# Altium schematic sheet USB接口 PHY_IO.schdoc
size 420 x 297 mm; Symbol: Drawing-Symbol_A4; Company: 嘉立创EDA; Version: V1.0; Page Size: A4; @Project Name: RK3566; @Update Date: 2026-10-05; @Create Date: 2026-05-22; Device: Drawing-Symbol_A4; @Board Name: Board1; @Page Name: P2; @Create Time: 17:31:19; @Page Count: 9; @Page No: 9; @Schematic Name: Schematic1; @Update Time: 17:31:19; @Assembly Variant: Basic; Border: 1; Title Block Position: 3; Size: A4; Width: 1655; Height: 1170; Region Start: 1; X Region Count: 6; Y Region Count: 4; Blade Width: 10; SheetNumber: 5; SheetTotal: 11
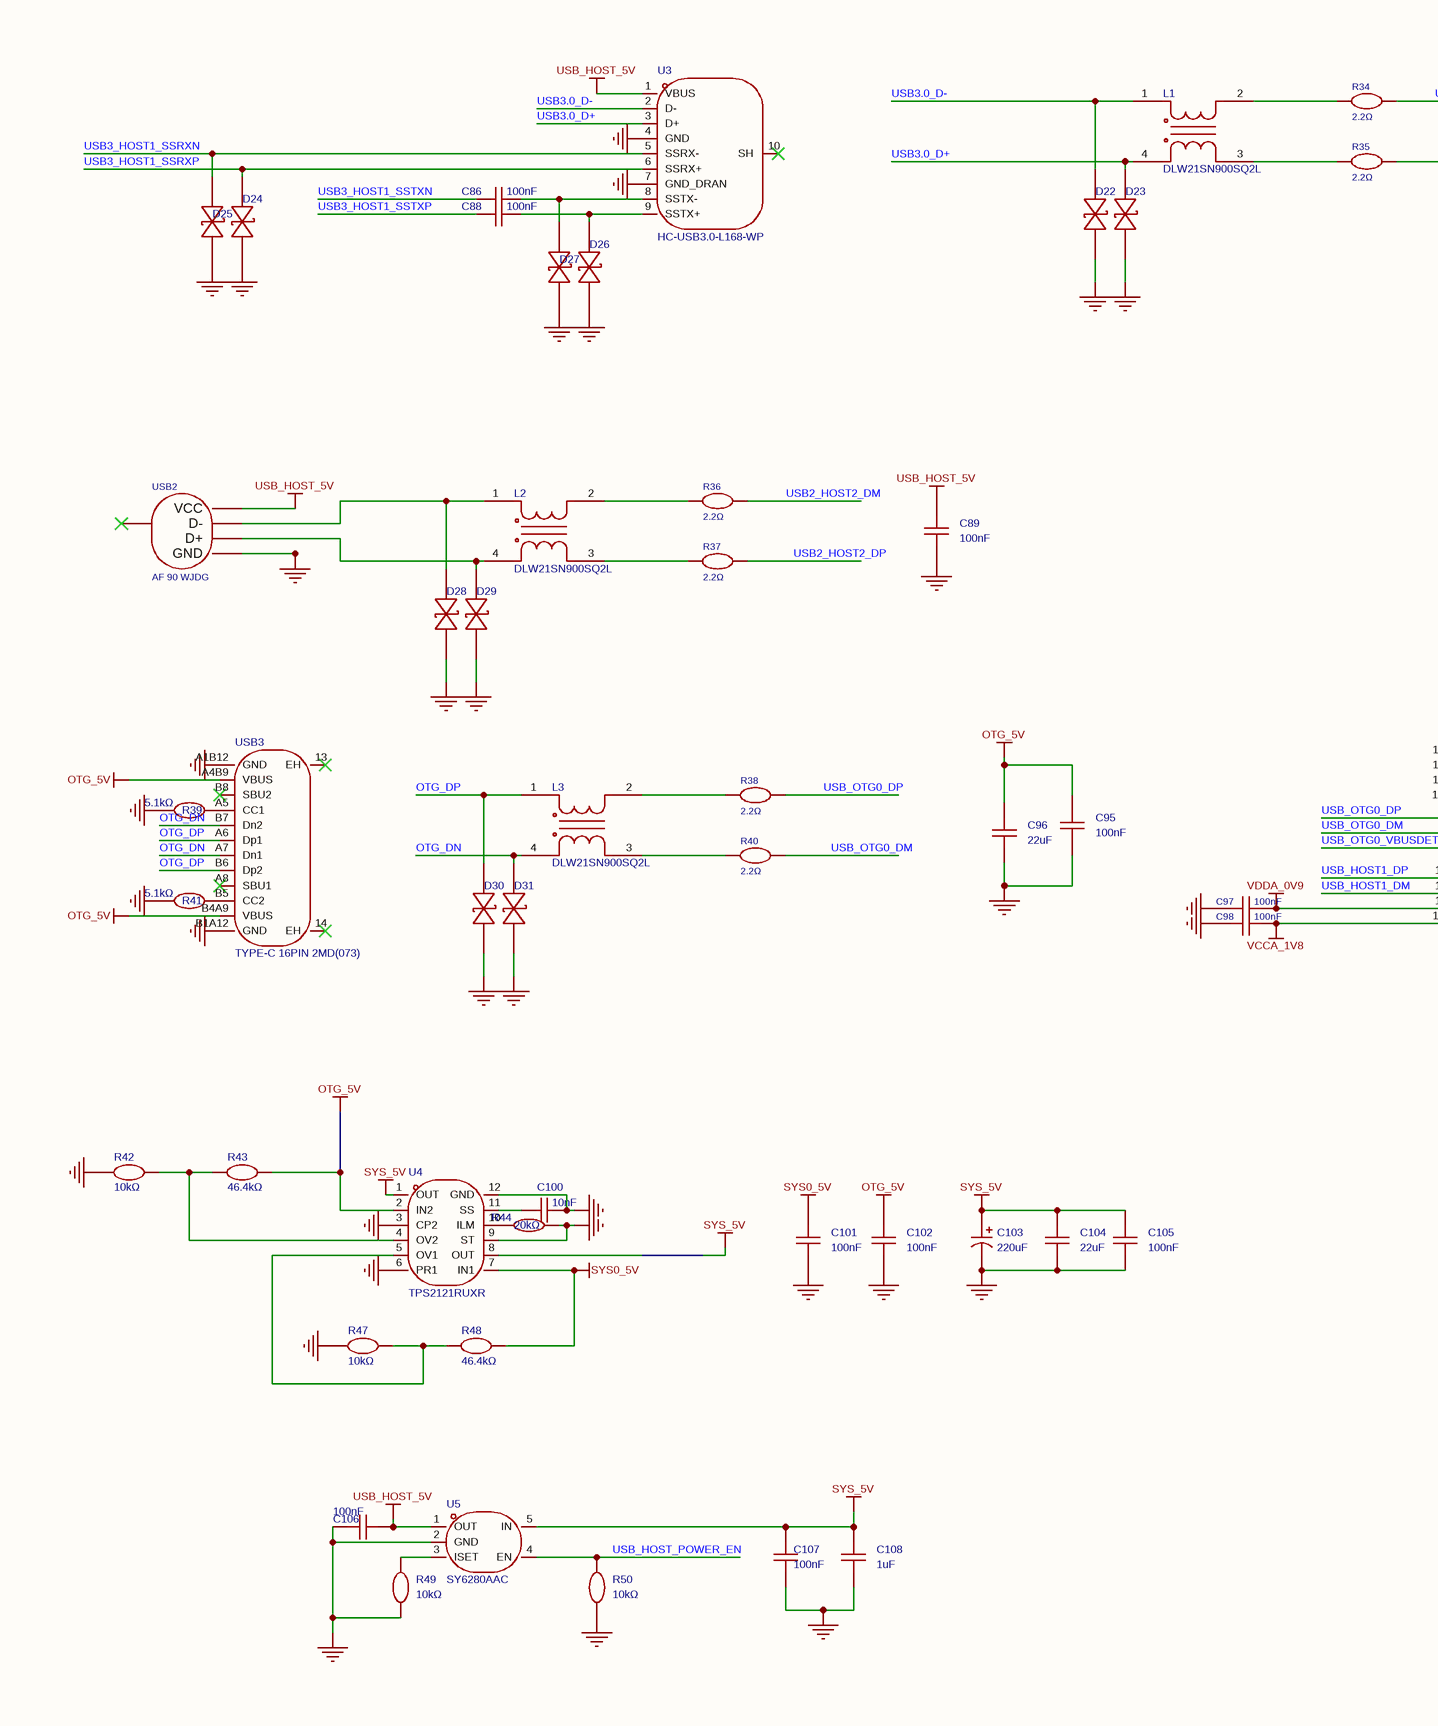
[diagram p0: USB接口 PHY_IO.schdoc, left]
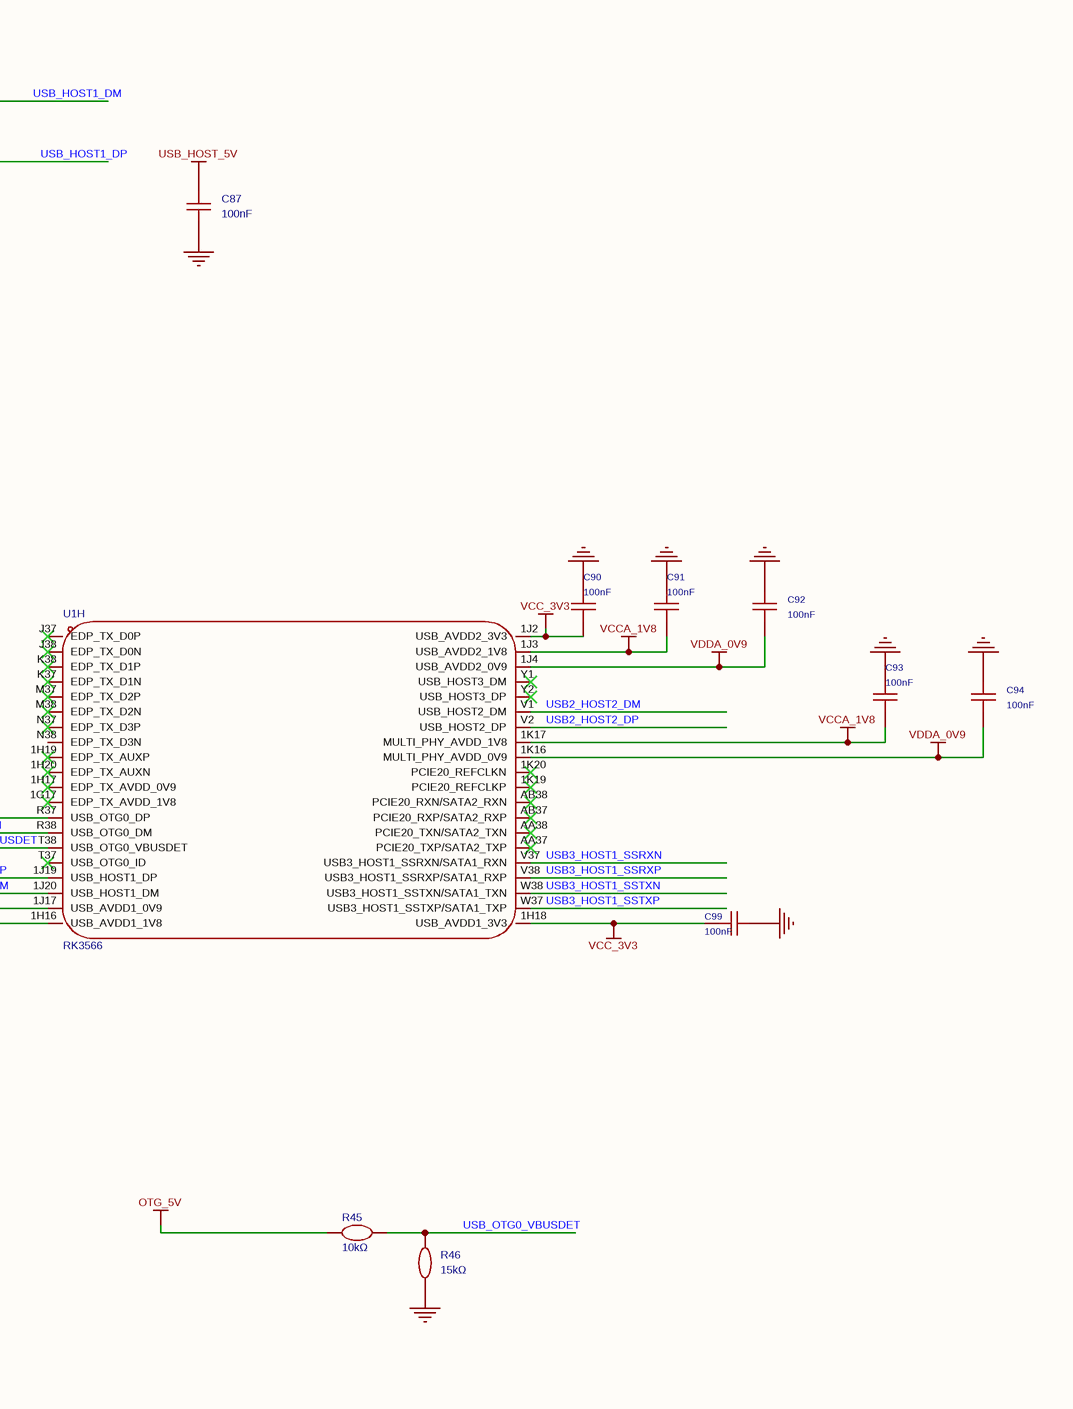
[diagram p1: USB接口 PHY_IO.schdoc, right]

## Parts
C86  100nF  [C0201]
C87  100nF  [C0402]
C88  100nF  [C0201]
C89  100nF  [C0402]
C90  100nF  [C0603]
C91  100nF  [C0603]
C92  100nF  [C0603]
C93  100nF  [C0603]
C94  100nF  [C0603]
C95  100nF  [C0402]
C96  22uF  [C0603]
C97  100nF  [C0603]
C98  100nF  [C0603]
C99  100nF  [C0603]
C100  10nF  [C0402]
C101  100nF  [C0402]
C102  100nF  [C0402]
C103  220uF  [CAP-SMD_BD6.3-L6.6-W6.6-LS7.3-FD]
C104  22uF  [C0603]
C105  100nF  [C0402]
C106  100nF  [C0402]
C107  100nF  [C0402]
C108  1uF  [C0402]
D22  BDFN1C051R  [DFN0603-D_L0.6-W0.3-P0.34-BI]  (value not drawn)
D23  BDFN1C051R  [DFN0603-D_L0.6-W0.3-P0.34-BI]  (value not drawn)
D24  BDFN1C051R  [DFN0603-D_L0.6-W0.3-P0.34-BI]  (value not drawn)
D25  BDFN1C051R  [DFN0603-D_L0.6-W0.3-P0.34-BI]  (value not drawn)
D26  BDFN1C051R  [DFN0603-D_L0.6-W0.3-P0.34-BI]  (value not drawn)
D27  BDFN1C051R  [DFN0603-D_L0.6-W0.3-P0.34-BI]  (value not drawn)
D28  BDFN1C051R  [DFN0603-D_L0.6-W0.3-P0.34-BI]  (value not drawn)
D29  BDFN1C051R  [DFN0603-D_L0.6-W0.3-P0.34-BI]  (value not drawn)
D30  BDFN1C051R  [DFN0603-D_L0.6-W0.3-P0.34-BI]  (value not drawn)
D31  BDFN1C051R  [DFN0603-D_L0.6-W0.3-P0.34-BI]  (value not drawn)
L1  DLW21SN900SQ2L  [FILTER-SMD_4P-L2.0-W1.2-BL_DLW21H]
L2  DLW21SN900SQ2L  [FILTER-SMD_4P-L2.0-W1.2-BL_DLW21H]
L3  DLW21SN900SQ2L  [FILTER-SMD_4P-L2.0-W1.2-BL_DLW21H]
R34  2.2Ω  [R0402]
R35  2.2Ω  [R0402]
R36  2.2Ω  [R0402]
R37  2.2Ω  [R0402]
R38  2.2Ω  [R0402]
R39  5.1kΩ  [R0402]
R40  2.2Ω  [R0402]
R41  5.1kΩ  [R0402]
R42  10kΩ  [R0402]
R43  46.4kΩ  [R0402]
R44  20kΩ  [R0402]
R45  10kΩ  [R0402]
R46  15kΩ  [R0402]
R47  10kΩ  [R0402]
R48  46.4kΩ  [R0402]
R49  10kΩ  [R0402]
R50  10kΩ  [R0402]
U1  RK3566  [BGA-565_L15.5-W14.4-P0.40_RK3566_1]  (part H of 8)
U3  HC-USB3.0-L168-WP  [USB-TH_USB3.0-A]
U4  TPS2121RUXR  [VQFN-HR-12_L2.5-W2.0-P0.50-BL]
U5  SY6280AAC  [SOT-23-5_L3.0-W1.7-P0.95-LS2.8-BL]
USB2  AF 90 WJDG  [USB-A-TH_AF-WJDG]
USB3  TYPE-C 16PIN 2MD(073)  [USB-C-SMD_TYPE-C-16PIN-2MD-073]

## Nets
GND: C87.1 C89.1 C90.2 C91.2 C92.2 C93.2 C94.2 C95.1 C96.1 C97.2 C98.2 C99.2 C100.2 C101.1 C102.1 C103.2 C104.1 C105.1 C106.2 C107.1 C108.1 D22.1 D23.1 D24.1 D25.1 D26.1 D27.1 D28.1 D29.1 D30.1 D31.1 R39.1 R41.1 R42.2 R44.2 R46.1 R47.2 R49.2 R50.2 U3.4(GND) U3.7(GND_DRAN) U4.3(CP2) U4.6(PR1) U4.9(ST) U4.12(GND) U5.2(GND) USB2.4(GND) USB3.A1B12(GND) USB3.B1A12(GND)
OTG_5V: C95.2 C96.2 C102.2 R43.2 R45.2 U4.2(IN2) USB3.A4B9(VBUS) USB3.B4A9(VBUS)
SYS0_5V: C101.2 R48.2 U4.7(IN1)
SYS_5V: C103.1 C104.2 C105.2 C107.2 C108.2 U4.1(OUT) U4.8(OUT) U5.5(IN)
USB_HOST_5V: C87.2 C89.2 C106.1 U3.1(VBUS) U5.1(OUT) USB2.1(VCC)
VCC_3V3: C90.1 C99.1 U1.1H18(USB_AVDD1_3V3) U1.1J2(USB_AVDD2_3V3)
VCCA_1V8: C91.1 C93.1 C98.1 U1.1H16(USB_AVDD1_1V8) U1.1J3(USB_AVDD2_1V8) U1.1K17(MULTI_PHY_AVDD_1V8)
VDDA_0V9: C92.1 C94.1 C97.1 U1.1J4(USB_AVDD2_0V9) U1.1J17(USB_AVDD1_0V9) U1.1K16(MULTI_PHY_AVDD_0V9)
OTG_DN: D31.2 L3.4 USB3.A7(Dn1) USB3.B7(Dn2)
OTG_DP: D30.2 L3.1 USB3.A6(Dp1) USB3.B6(Dp2)
USB2_HOST2_DM: R36.2 U1.V1(USB_HOST2_DM)
USB2_HOST2_DP: R37.2 U1.V2(USB_HOST2_DP)
USB3.0_D+: D23.2 L1.4 U3.3(D+)
USB3.0_D-: D22.2 L1.1 U3.2(D-)
USB3_HOST1_SSRXN: D25.2 U1.V37(USB3_HOST1_SSRXN/SATA1_RXN) U3.5(SSRX-)
USB3_HOST1_SSRXP: D24.2 U1.V38(USB3_HOST1_SSRXP/SATA1_RXP) U3.6(SSRX+)
USB3_HOST1_SSTXN: C86.1 U1.W38(USB3_HOST1_SSTXN/SATA1_TXN)
USB3_HOST1_SSTXP: C88.1 U1.W37(USB3_HOST1_SSTXP/SATA1_TXP)
USB_HOST1_DM: R34.2 U1.1J20(USB_HOST1_DM)
USB_HOST1_DP: R35.2 U1.1J19(USB_HOST1_DP)
USB_HOST_POWER_EN: R50.1 U5.4(EN)
USB_OTG0_DM: R40.2 U1.R38(USB_OTG0_DM)
USB_OTG0_DP: R38.2 U1.R37(USB_OTG0_DP)
USB_OTG0_VBUSDET: R45.1 R46.2 U1.T38(USB_OTG0_VBUSDET)
NetC86_2: C86.2 D27.2 U3.8(SSTX-)
NetC88_2: C88.2 D26.2 U3.9(SSTX+)
NetC100_1: C100.1 U4.11(SS)
NetD28_2: D28.2 L2.1 USB2.2(D-)
NetD29_2: D29.2 L2.4 USB2.3(D+)
NetL1_2: L1.2 R34.1
NetL1_3: L1.3 R35.1
NetL2_2: L2.2 R36.1
NetL2_3: L2.3 R37.1
NetL3_2: L3.2 R38.1
NetL3_3: L3.3 R40.1
NetR39_2: R39.2 USB3.A5(CC1)
NetR41_2: R41.2 USB3.B5(CC2)
NetR42_1: R42.1 R43.1 U4.4(OV2)
NetR44_1: R44.1 U4.10(ILM)
NetR47_1: R47.1 R48.1 U4.5(OV1)
NetR49_1: R49.1 U5.3(ISET)

Not connected (* = marked no-connect by the designer): U1 1G17(EDP_TX_AVDD_1V8)* 1H17(EDP_TX_AVDD_0V9)* 1H19(EDP_TX_AUXP)* 1H20(EDP_TX_AUXN)* 1K19(PCIE20_REFCLKP)* 1K20(PCIE20_REFCLKN)* AA37(PCIE20_TXP/SATA2_TXP)* AA38(PCIE20_TXN/SATA2_TXN)* AB37(PCIE20_RXP/SATA2_RXP)* AB38(PCIE20_RXN/SATA2_RXN)* J37(EDP_TX_D0P)* J38(EDP_TX_D0N)* K37(EDP_TX_D1N)* K38(EDP_TX_D1P)* M37(EDP_TX_D2P)* M38(EDP_TX_D2N)* N37(EDP_TX_D3P)* N38(EDP_TX_D3N) T37(USB_OTG0_ID)* Y1(USB_HOST3_DM)* Y2(USB_HOST3_DP)*; U3 10(SH)*; USB2 5(SHLD)*; USB3 13(EH)* 14(EH)* A8(SBU1)* B8(SBU2)*

## Notes on the sheet
- 创建日期
- 2026-10-05
- 原理图
- 板子
- Schematic1
- Board1
- 更新日期
- 图页
- P2
- 绘制
- 审阅
- RK3566
- 版本
- V1.0
- 尺寸
- A4
- 页    9    共    9
- 嘉立创EDA

## Library data of the parts
C86 C88 = GRM033R61E104KE14D: 容值:100nF;精度:±10%;额定电压:25V;温度系数:X5R;; Manufacturer: muRata(村田); AddInBom: yes; ModelId: e8033a7cb35143ffb28e3b81b2577ea0聨0819f05c4eef4c71ace90d822a990e87; ModelName: C0201_L0.6-W0.3-H0.3; ModelTransform: 23.622,11.811,0,0,0,0,0,0,0; Tolerance: ±10%; Voltage Rating: 25V; Temperature Coefficient: X5R; Symbol: GRM033R61E104KE14D; Device: GRM033R61E104KE14D; LCSC Part Name: 100nF ±10% 25V; SupplierPart: C76939; ManufacturerPart: GRM033R61E104KE14D; Supplier Footprint: 0201; JLCPCB Part Class: Extended Part; Datasheet: https://item.szlcsc.com/datasheet/GRM033R61E104KE14D/78066.html; Supplier: LCSC; ConvertToPcb: yes; FootprintName: C0201; Value: 100nF
C87 C89 C95 C101 C102 C105-C107 = CL05B104KO5NNNC: 容值:100nF;精度:±10%;额定电压:16V;温度系数:X7R;; Manufacturer: SAMSUNG(三星); 3D Model: 36a51122f27c49738f86b3bfa98863e0聨0819f05c4eef4c71ace90d822a990e87; 3D Model Transform: 39.37,19.685,0,0,0,0,0,0,0; Tolerance: ±10%; Voltage Rating: 16V; Temperature Coefficient: X7R; AddInBom: yes; ModelName: C0402_L1.0-W0.5-H0.5; Symbol: CL05B104KO5NNNC; Device: CL05B104KO5NNNC; LCSC Part Name: 100nF ±10% 16V; Supplier Part: C1525; Manufacturer Part: CL05B104KO5NNNC; Supplier Footprint: 0402; JLCPCB Part Class: Basic Part; Datasheet: https://item.szlcsc.com/datasheet/CL05B104KO5NNNC/1877.html; Supplier: LCSC; Value: 100nF; ConvertToPcb: yes; FootprintName: C0402
C90-C94 C97-C99 = CC0603KRX7R9BB104: 容值:100nF;精度:±10%;额定电压:50V;温度系数:X7R;; Manufacturer: YAGEO(国巨); AddInBom: yes; ModelId: ac125912035d415993ca9572d50418b1聨0819f05c4eef4c71ace90d822a990e87; ModelName: C0603_L1.6-W0.8-H0.8; ModelTransform: 62.992,31.496,0,0,0,0,0,0,0; Tolerance: ±10%; Voltage Rating: 50V; Temperature Coefficient: X7R; Symbol: CC0603KRX7R9BB104; Device: CC0603KRX7R9BB104; LCSC Part Name: 100nF ±10% 50V; SupplierPart: C14663; ManufacturerPart: CC0603KRX7R9BB104; Supplier Footprint: 0603; JLCPCB Part Class: Basic Part; Datasheet: https://item.szlcsc.com/datasheet/CC0603KRX7R9BB104/15331.html; Supplier: LCSC; ConvertToPcb: yes; FootprintName: C0603; Value: 100nF
C96 C104 = HGC0603R5226M100NTHJ: 容值:22uF;精度:±20%;额定电压:10V;温度系数:X5R;; Manufacturer: Chinocera(华瓷); 3D Model: ac125912035d415993ca9572d50418b1聨0819f05c4eef4c71ace90d822a990e87; 3D Model Transform: 62.992,31.496,0,0,0,0,0,0,0; Tolerance: ±20%; Voltage Rating: 10V; Temperature Coefficient: X5R; AddInBom: yes; ModelName: C0603_L1.6-W0.8-H0.8; Symbol: HGC0603R5226M100NTHJ; Device: HGC0603R5226M100NTHJ; LCSC Part Name: 22uF ±20% 10V; Supplier Part: C7432770; Manufacturer Part: HGC0603R5226M100NTHJ; Supplier Footprint: 0603; JLCPCB Part Class: Extended Part; Datasheet: https://item.szlcsc.com/datasheet/HGC0603R5226M100NTHJ/8438252.html; Supplier: LCSC; Value: 22uF; ConvertToPcb: yes; FootprintName: C0603
C100 = CL05B103KB5NNNC: 容值:10nF;精度:±10%;额定电压:50V;温度系数:X7R;; Manufacturer: SAMSUNG(三星); AddInBom: yes; ModelId: 36a51122f27c49738f86b3bfa98863e0聨0819f05c4eef4c71ace90d822a990e87; ModelName: C0402_L1.0-W0.5-H0.5; ModelTransform: 39.37,19.685,0,0,0,0,0,0,0; Tolerance: ±10%; Voltage Rating: 50V; Temperature Coefficient: X7R; Symbol: CL05B103KB5NNNC; Device: CL05B103KB5NNNC; LCSC Part Name: 10nF ±10% 50V; SupplierPart: C15195; ManufacturerPart: CL05B103KB5NNNC; Supplier Footprint: 0402; JLCPCB Part Class: Basic Part; Datasheet: https://item.szlcsc.com/datasheet/CL05B103KB5NNNC/15869.html; Supplier: LCSC; ConvertToPcb: yes; FootprintName: C0402; Value: 10nF
C103 = MA25V220M6X8: 容值:220uF;精度:±20%;额定电压:25V;纹波电流:2.9A@100kHz;等效串联电阻(ESR):28mΩ@100kHz;类型:聚合物;; Manufacturer: JIERR(捷而瑞); AddInBom: yes; ModelId: 697a8c63e3274188b68c96045bc3ea1c聨0819f05c4eef4c71ace90d822a990e87; ModelTransform: 287.401,259.842,0,180,0,0,0.001,0.001,0; Tolerance: ±20%; Voltage Rating: 25V; Type: 聚合物; Lifetime: 2000hrs@105℃; Polarity type: 有极性; Symbol: MA25V220M6X8; Device: MA25V220M6X8; LCSC Part Name: 220uF ±20% 25V; SupplierPart: C46550464; ManufacturerPart: MA25V220M6X8; Supplier Footprint: SMD,D6.3xL7.7mm; JLCPCB Part Class: Extended Part; Datasheet: https://item.szlcsc.com/datasheet/MA25V220M6X8/48680158.html; Supplier: LCSC; ConvertToPcb: yes; FootprintName: CAP-SMD_BD6.3-L6.6-W6.6-LS7.3-FD; ModelName: CAP-SMD_BD6.3-L6.6-W6.6-LS7.3-FD; Value: 220uF; Ripple Current: 2.9A@100kHz; Equivalent Series Resistance(ESR): 28mΩ@100kHz; Diameter: 6.3mm; Height - Seated (Max): 7.7mm; Operating Temperature: -55℃~+105℃
C108 = HGC0402R5105K500NTEJ: 容值:1uF;精度:±10%;额定电压:50V;温度系数:X5R;; Manufacturer: Chinocera(华瓷); 3D Model: 36a51122f27c49738f86b3bfa98863e0聨0819f05c4eef4c71ace90d822a990e87; 3D Model Transform: 39.37,19.685,0,0,0,0,0,0,0; Tolerance: ±10%; Voltage Rating: 50V; Temperature Coefficient: X5R; AddInBom: yes; ModelName: C0402_L1.0-W0.5-H0.5; Symbol: HGC0402R5105K500NTEJ; Device: HGC0402R5105K500NTEJ; LCSC Part Name: 1uF ±10% 50V; Supplier Part: C7472948; Manufacturer Part: HGC0402R5105K500NTEJ; Supplier Footprint: 0402; JLCPCB Part Class: Extended Part; Datasheet: https://item.szlcsc.com/datasheet/HGC0402R5105K500NTEJ/8532795.html; Supplier: LCSC; Value: 1uF; ConvertToPcb: yes; FootprintName: C0402
D22-D31 = BDFN1C051R: 极性:双向;反向截止电压(Vrwm):5V;钳位电压:13V;峰值脉冲电流(Ipp):4A@8/20us;击穿电压(VBR):5.5V;; Manufacturer: BORN(伯恩半导体); AddInBom: yes; ModelId: 295ccb0e91f84fca9fcc42e8f031306b聨0819f05c4eef4c71ace90d822a990e87; ModelName: DFN0603-D_L0.6-W0.3--H0.3-P0.34-BI; ModelTransform: 24.0157,12.2047,0,0,0,0,0,0,0; Polarity: 双向; Reverse Stand-Off Voltage (Vrwm): 5V; Clamping Voltage: 13V; Voltage - Breakdown: 5.5V; Reverse Leakage Current (Ir): 100nA; Number of Channels: 单路; level of protection: IEC 61000-4-4；IEC 61000-4-5；IEC 61000-4-2; Type: ESD; Junction Capacitance: 0.2pF; Symbol: BDFN1C051R; Device: BDFN1C051R; LCSC Part Name: 双向ESD 5V截止 峰值脉冲电流：4A@8/20us; SupplierPart: C152032; ManufacturerPart: BDFN1C051R; Supplier Footprint: DFN0603-D; JLCPCB Part Class: Extended Part; Datasheet: https://item.szlcsc.com/datasheet/BDFN1C051R/163372.html; Supplier: LCSC; ConvertToPcb: yes; FootprintName: DFN0603-D_L0.6-W0.3-P0.34-BI; Peak Pulse Current (Ipp): 4A@8/20us
L1-L3 = DLW21SN900SQ2L: 通道数:2;阻抗@频率:90Ω@100MHz;直流电阻(DCR):-;; Manufacturer: muRata(村田); AddInBom: yes; ModelId: 2ee9896fb24849a1ae3ad995e0a10c07聨0819f05c4eef4c71ace90d822a990e87; ModelName: SMD-4_L2.0-W1.2-H1.3; ModelTransform: 79.527,47.244,0,90,0,0,0,0,0; Number of Lines: 2; Current Rating: 330mA; Symbol: DLW21SN900SQ2L; Device: DLW21SN900SQ2L; LCSC Part Name: 两路 贴片共模滤波器 阻抗90Ω@100MHz; SupplierPart: C97856; ManufacturerPart: DLW21SN900SQ2L; Supplier Footprint: SMD-4P,2x1.2mm; JLCPCB Part Class: Extended Part; Datasheet: https://item.szlcsc.com/datasheet/DLW21SN900SQ2L/99065.html; Supplier: LCSC; ConvertToPcb: yes; FootprintName: FILTER-SMD_4P-L2.0-W1.2-BL_DLW21H; Voltage Rating - DC: -; Impedance @ Frequency: 90Ω@100MHz; DC Resistance(DCR): -; Operating Temperature: -40℃~+85℃
R34-R38 R40 = FRC0402J2R2 TS: 电阻类型:厚膜电阻;阻值:2.2Ω;精度:±5%;功率:62.5mW;工作电压:50V;温度系数:±400ppm/℃;; Manufacturer: FOJAN(富捷); AddInBom: yes; ModelId: 98c88bc2b9094f218f3a3e30a7012738聨0819f05c4eef4c71ace90d822a990e87; ModelName: R0402_L1.0-W0.5-H0.4; ModelTransform: 39.37,19.685,0,0,0,0,0,0,0; Tolerance: ±5%; Power(Watts): 62.5mW; Voltage-Supply(Max): 50V; Symbol: FRC0402J2R2 TS; Device: FRC0402J2R2 TS; LCSC Part Name: FRC0402J2R2 TS; SupplierPart: C2906903; ManufacturerPart: FRC0402J2R2 TS; Supplier Footprint: 0402; JLCPCB Part Class: Extended Part; Datasheet: https://item.szlcsc.com/datasheet/FRC0402J2R2%2520TS/3180416.html; Supplier: LCSC; ConvertToPcb: yes; FootprintName: R0402; Type: 厚膜电阻; Value: 2.2Ω; Temperature Coefficient: ±400ppm/℃; Operating Temperature: -55℃~+155℃
R39 R41 = FRC0402J512 TS: 电阻类型:厚膜电阻;阻值:5.1kΩ;精度:±5%;功率:62.5mW;工作电压:50V;温度系数:±100ppm/℃;; Manufacturer: FOJAN(富捷); AddInBom: yes; ModelId: 98c88bc2b9094f218f3a3e30a7012738聨0819f05c4eef4c71ace90d822a990e87; ModelName: R0402_L1.0-W0.5-H0.4; ModelTransform: 39.37,19.685,0,0,0,0,0,0,0; Tolerance: ±5%; Power(Watts): 62.5mW; Voltage-Supply(Max): 50V; Symbol: FRC0402J512 TS; Device: FRC0402J512 TS; LCSC Part Name: 5.1kΩ ±5% 62.5mW 厚膜电阻; SupplierPart: C2906948; ManufacturerPart: FRC0402J512 TS; Supplier Footprint: 0402; JLCPCB Part Class: Extended Part; Datasheet: https://item.szlcsc.com/datasheet/FRC0402J512%2520TS/3180461.html; Supplier: LCSC; ConvertToPcb: yes; FootprintName: R0402; Type: 厚膜电阻; Value: 5.1kΩ; Temperature Coefficient: ±100ppm/℃; Operating Temperature: -55℃~+155℃
R42 R45 R47 R49 R50 = FRC0402F1002TS: 电阻类型:厚膜电阻;阻值:10kΩ;精度:±1%;功率:62.5mW;工作电压:50V;温度系数:±100ppm/℃;; Manufacturer: FOJAN(富捷); 3D Model: 98c88bc2b9094f218f3a3e30a7012738聨0819f05c4eef4c71ace90d822a990e87; 3D Model Transform: 39.37,19.685,0,0,0,0,0,0,0; Tolerance: ±1%; Power(Watts): 62.5mW; Voltage-Supply(Max): 50V; AddInBom: yes; ModelName: R0402_L1.0-W0.5-H0.4; Symbol: FRC0402F1002TS; Device: FRC0402F1002TS; LCSC Part Name: 10kΩ ±1% 62.5mW 厚膜电阻; Supplier Part: C2906861; Manufacturer Part: FRC0402F1002TS; Supplier Footprint: 0402; JLCPCB Part Class: Extended Part; Datasheet: https://item.szlcsc.com/datasheet/FRC0402F1002TS/3180374.html; Supplier: LCSC; Type: 厚膜电阻; Value: 10kΩ; Temperature Coefficient: ±100ppm/℃; Operating Temperature: -55℃~+155℃; ConvertToPcb: yes; FootprintName: R0402
R43 R48 = FRC0402F4642TS: 电阻类型:厚膜电阻;阻值:46.4kΩ;精度:±1%;功率:62.5mW;工作电压:50V;温度系数:±100ppm/℃;; Manufacturer: FOJAN(富捷); AddInBom: yes; ModelId: 98c88bc2b9094f218f3a3e30a7012738聨0819f05c4eef4c71ace90d822a990e87; ModelName: R0402_L1.0-W0.5-H0.4; ModelTransform: 39.37,19.685,0,0,0,0,0,0,0; Tolerance: ±1%; Power(Watts): 62.5mW; Voltage-Supply(Max): 50V; Symbol: FRC0402F4642TS; Device: FRC0402F4642TS; LCSC Part Name: 46.4kΩ ±1% 62.5mW 厚膜电阻; SupplierPart: C5126026; ManufacturerPart: FRC0402F4642TS; Supplier Footprint: 0402; JLCPCB Part Class: Extended Part; Datasheet: https://item.szlcsc.com/datasheet/FRC0402F4642TS/5726373.html; Supplier: LCSC; ConvertToPcb: yes; FootprintName: R0402; Type: 厚膜电阻; Value: 46.4kΩ; Temperature Coefficient: ±100ppm/℃; Operating Temperature: -55℃~+155℃
R44 = FRC0402F2002TS: 电阻类型:厚膜电阻;阻值:20kΩ;精度:±1%;功率:62.5mW;工作电压:50V;温度系数:±100ppm/℃;; Manufacturer: FOJAN(富捷); AddInBom: yes; ModelId: 98c88bc2b9094f218f3a3e30a7012738聨0819f05c4eef4c71ace90d822a990e87; ModelName: R0402_L1.0-W0.5-H0.4; ModelTransform: 39.37,19.685,0,0,0,0,0,0,0; Tolerance: ±1%; Power(Watts): 62.5mW; Voltage-Supply(Max): 50V; Symbol: FRC0402F2002TS; Device: FRC0402F2002TS; LCSC Part Name: 20kΩ ±1% 62.5mW 厚膜电阻; SupplierPart: C2906867; ManufacturerPart: FRC0402F2002TS; Supplier Footprint: 0402; JLCPCB Part Class: Extended Part; Datasheet: https://item.szlcsc.com/datasheet/FRC0402F2002TS/3180380.html; Supplier: LCSC; ConvertToPcb: yes; FootprintName: R0402; Type: 厚膜电阻; Value: 20kΩ; Temperature Coefficient: ±100ppm/℃; Operating Temperature: -55℃~+155℃
R46 = 0402WGF1502TCE: 电阻类型:厚膜电阻;阻值:15kΩ;精度:±1%;功率:62.5mW;最大工作电压:50V;温度系数:±100ppm/℃;; Manufacturer: UNI-ROYAL(厚声); AddInBom: yes; ModelId: 98c88bc2b9094f218f3a3e30a7012738聨0819f05c4eef4c71ace90d822a990e87; ModelName: R0402_L1.0-W0.5-H0.4; ModelTransform: 39.37,19.685,0,0,0,0,0,0,0; Tolerance: ±1%; Power(Watts): 62.5mW; Overload Voltage (Max): 50V; Symbol: 0402WGF1502TCE; Device: 0402WGF1502TCE; LCSC Part Name: 15kΩ ±1% 62.5mW 厚膜电阻; SupplierPart: C25756; ManufacturerPart: 0402WGF1502TCE; Supplier Footprint: 0402; JLCPCB Part Class: Basic Part; Datasheet: https://atta.szlcsc.com/upload/public/pdf/source/20200306/C422600_1E6D84923E4A46A82E41ADD87F860B5C.pdf; Supplier: LCSC; ConvertToPcb: yes; FootprintName: R0402; Type: 厚膜电阻; Value: 15kΩ; Temperature Coefficient: ±100ppm/℃; Operating Temperature Range: -55℃~+155℃
U1 = RK3566: 是一款高性能、低功耗的四核应用处理器，专为个人移动互联网设备和AIoT设备设计。提供了许多嵌入式强大硬件引擎，以优化高端应用的性能。支持几乎全格式的H.264 4K@60fps解码器、H.265 4K@60fps解码器，还支持H.264/H.265 1080p@60fps编码器、高质量JPEG编码器/解码器。嵌入式3D GPU使其完全兼容OpenGL ES 1.1/2.0/3.2、OpenCL 2.0和Vulkan 1.1; Manufacturer: Rockchip(瑞芯微); Relevance: []; 3D Model: 096be4498db445d8b521581a084e15ec聨0819f05c4eef4c71ace90d822a990e87; 3D Model Transform: 610.235,566.928,0,0,0,0,0,0,0; AddInBom: yes; Symbol: RK3566; Device: RK3566; LCSC Part Name: 表面贴装型开关全行程、动作力等性能; Supplier Part: C2943786; Manufacturer Part: RK3566; Supplier Footprint: BGA-565(15.5x14.4); JLCPCB Part Class: Extended Part; Datasheet: https://item.szlcsc.com/datasheet/RK3566/3329057.html; Supplier: LCSC; ConvertToPcb: yes; FootprintName: BGA-565_L15.5-W14.4-P0.40_RK3566_1; ModelName: BGA-565_L15.5-W14.4-P0.40_RK3566_1
U3 = HC-USB3.0-L168-WP: 连接器类型:Type-A;协议标准:USB 3.0;公母:母;安装方式:弯插;触点数量:9P;端口数量:1;额定电流 - 电源:1.5A;工作温度:-25℃~+70℃;; Manufacturer: HC(虹成电子); AddInBom: yes; ModelId: a6994728bee34198bb5c5e1920a86239聨0819f05c4eef4c71ace90d822a990e87; ModelTransform: 614.14546,661.41998,0,0,0,0,-0.001,-204.724,-137.795; Connector Type: Type-A; Protocol Standard: USB 3.0; Gender: 母; Number of Contacts: 9P; Number of Ports: 1; Current Rating-Power: 1.5A; Voltage Rating: 30V; Connect-Disconnect Life: 1.5千次; Detection color: 蓝色; Symbol: HC-USB3.0-L168-WP; Device: HC-USB3.0-L168-WP; LCSC Part Name: Type-A 母 弯插 USB3.0 A母90度 弯脚蓝色平口 吸塑盒; SupplierPart: C7501850; ManufacturerPart: HC-USB3.0-L168-WP; Supplier Footprint: 弯插; JLCPCB Part Class: Extended Part; Datasheet: https://item.szlcsc.com/datasheet/HC-USB3.0-L168-WP/8585391.html; Supplier: LCSC; ConvertToPcb: yes; FootprintName: USB-TH_USB3.0-A; ModelName: USB-TH_USB3.0-A; Mounting Type: 弯插; Supplementary Features: -; Center Height: -; Length: 16.8mm; Operating Temperature: -25℃~+70℃
U4 = TPS2121RUXR: TPS2121 支持无缝切换的 2.7V 至 22V、56mΩ、4.5A 电源多路复用器; Manufacturer: TI(德州仪器); AddInBom: yes; ModelId: 23ed45b0241644698956addf625daed0聨0819f05c4eef4c71ace90d822a990e87; ModelName: VQFN-HR-12_L2.5-W2.0-H1.0-P0.50-BL; ModelTransform: 78.74,98.425,0,90,0,0,-0.004,0.002,0; Symbol: TPS2121RUXR; Device: TPS2121RUXR; LCSC Part Name: TPS2121RUXR; SupplierPart: C485916; ManufacturerPart: TPS2121RUXR; Supplier Footprint: VQFN-HR-12(2x2.5); JLCPCB Part Class: Extended Part; Datasheet: https://www.ti.com/cn/lit/gpn/tps2121; Supplier: LCSC; ConvertToPcb: yes; FootprintName: VQFN-HR-12_L2.5-W2.0-P0.50-BL
U5 = SY6280AAC_C55136: 类型:高侧开关;通道数:1;输入控制逻辑:高电平有效;工作电压:2.4V~5.5V;最大连续电流:2A;导通电阻:80mΩ;; Manufacturer: Silergy(矽力杰); AddInBom: yes; ModelId: 0a2a1b8f50944f73965918ad6e5fe167聨0819f05c4eef4c71ace90d822a990e87; ModelName: SOT-23-5_L2.9-W1.6-H1.1-LS2.8-P0.95; ModelTransform: 118.60433,114.173,0,90,0,0,0.0005,0.0005,0; Number of Channels: 1; Control Input Logic: 高电平有效; Maximum Continuous Current: 2A; RDS(on): 80mΩ; Symbol: SY6280AAC; Device: SY6280AAC_C55136; LCSC Part Name: 低损耗功率分配开关; SupplierPart: C55136; ManufacturerPart: SY6280AAC; Supplier Footprint: SOT-23-5; JLCPCB Part Class: Extended Part; Datasheet: https://item.szlcsc.com/datasheet/SY6280AAC/56162.html; Supplier: LCSC; ConvertToPcb: yes; FootprintName: SOT-23-5_L3.0-W1.7-P0.95-LS2.8-BL; Type: 高侧开关; Voltage - Supply: 2.4V~5.5V; Features: 短路保护；过流保护；反向电流阻断；输出放电功能；过温保护; Operating Temperature	-: -40℃~+125℃
USB2 = AF 90 WJDG: 连接器类型:Type-A;协议标准:USB 2.0;公母:母;安装方式:弯插;触点数量:4P;端口数量:1;额定电流 - 电源:1.5A;工作温度:-25℃~+85℃;; Manufacturer: SHOU HAN(首韩); Symbol: AF 90° WJDG; AddInBom: yes; ModelId: 268f7f19b8674295a50f5e7a4a3dee80聨0819f05c4eef4c71ace90d822a990e87; ModelName: USB-A-TH_4P-L14.5-W14.0-H7.6-S2.71; ModelTransform: 610.19406,551.18,0,0,0,0,0,-192.915,-149.606; Connector Type: Type-A; Protocol Standard: USB 2.0; Gender: 母; Number of Contacts: 4P; Number of Ports: 1; Current Rating-Power: 1.5A; Voltage Rating: 30V; Connect-Disconnect Life: 5千次; Detection color: 白色; Device: AF 90 WJDG; LCSC Part Name: Type-A弯插母座; SupplierPart: C456018; ManufacturerPart: AF 90 WJDG; Supplier Footprint: 弯插; JLCPCB Part Class: Extended Part; Datasheet: https://item.szlcsc.com/datasheet/AF%252090%2520WJDG/458825.html; Supplier: LCSC; ConvertToPcb: yes; FootprintName: USB-A-TH_AF-WJDG; Mounting Type: 弯插; Supplementary Features: -; Center Height: -; Length: 14mm; Operating Temperature: -25℃~+85℃
USB3 = TYPE-C 16PIN 2MD(073): 连接器类型:Type-C;协议标准:-;公母:母;安装方式:卧贴;触点数量:16P;端口数量:1;额定电流 - 电源:3A;工作温度:-25℃~+85℃;; Manufacturer: SHOU HAN(首韩); AddInBom: yes; ModelId: 3a41b9ec9b654a0fad4d118405ec6290聨0819f05c4eef4c71ace90d822a990e87; ModelName: USB-C-SMD_TYPE-C-6PIN-2MD-073; ModelTransform: 351.9678,298.4246,0,0,0,0,0,-47.244,-35.433; Gender: 母; Number of Contacts: 16P; Number of Ports: 1; Current Rating-Power: 3A; Voltage Rating: 5V; Connect-Disconnect Life: 1万次; Detection color: 黑色; Symbol: TYPE-C 16PIN 2MD(073); Device: TYPE-C 16PIN 2MD(073); LCSC Part Name: Type-C 母 卧贴; SupplierPart: C2765186; ManufacturerPart: TYPE-C 16PIN 2MD(073); Supplier Footprint: SMD; JLCPCB Part Class: Extended Part; Datasheet: https://item.szlcsc.com/datasheet/TYPE-C%252016PIN%25202MD(073)/2901843.html; Supplier: LCSC; ConvertToPcb: yes; FootprintName: USB-C-SMD_TYPE-C-16PIN-2MD-073; Connector Type: Type-C; Protocol Standard: -; Mounting Type: 卧贴; Supplementary Features: -; Center Height: -; Length: 7.35mm; Operating Temperature: -25℃~+85℃